# Altium schematic sheet Peripherals.SchDoc
size A4; SheetNumber: 3; SheetTotal: 6
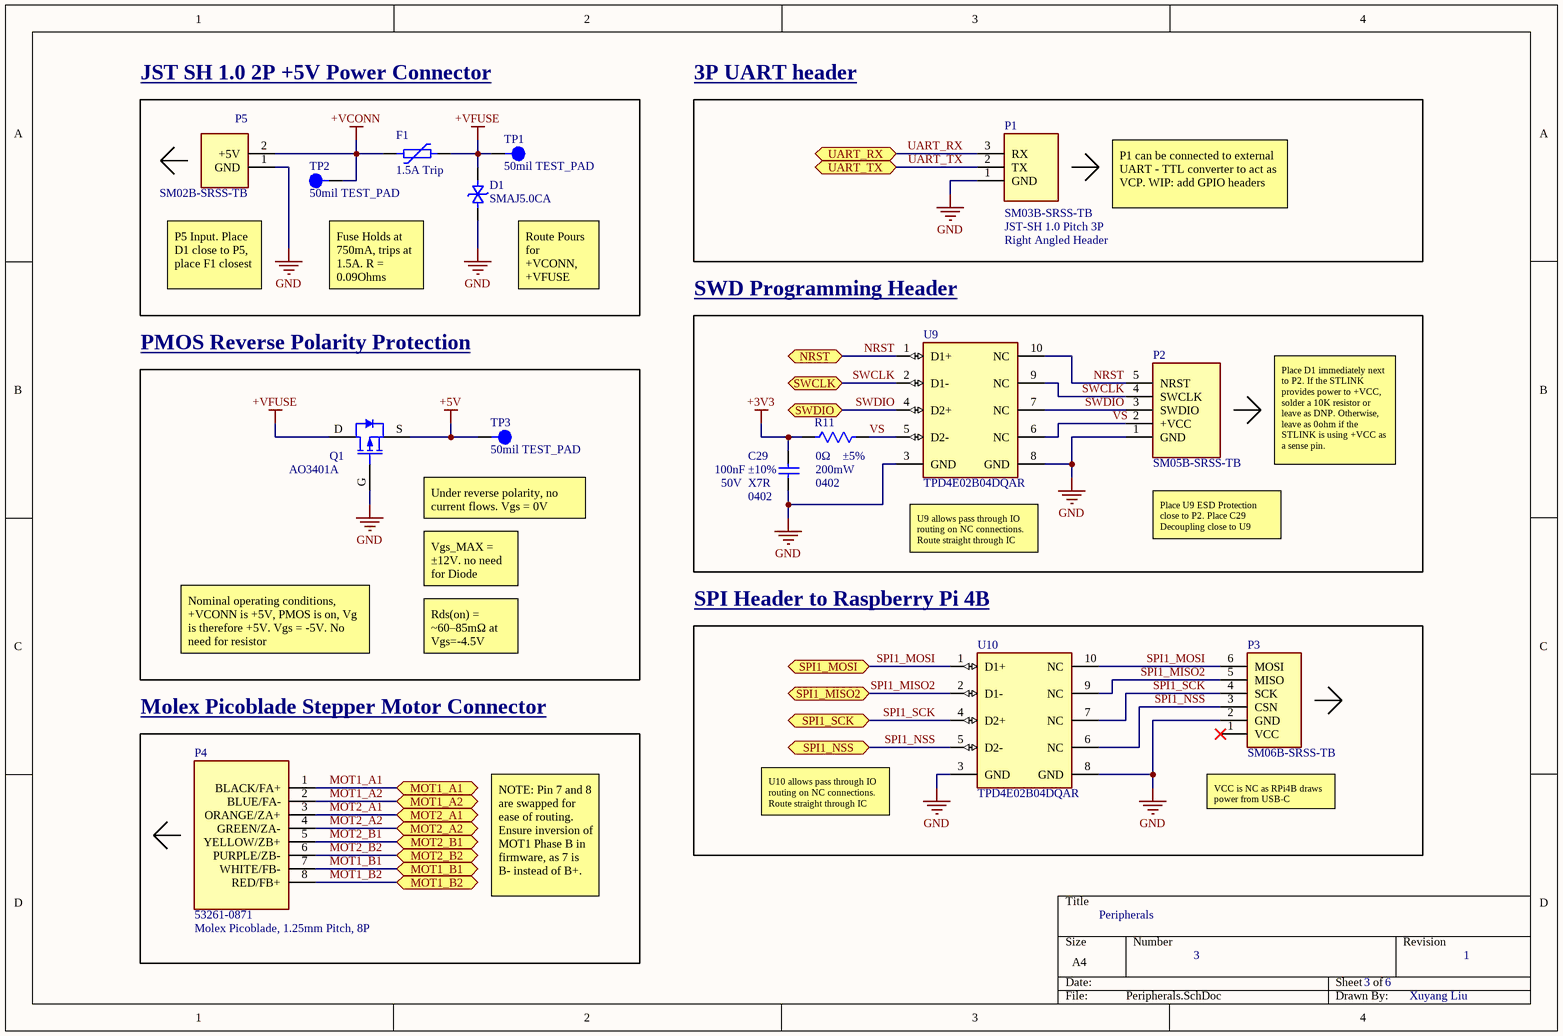
[diagram p0: Peripherals.SchDoc]

## Parts
C29  Case/Package: 0402  Voltage Rating: 50V  Dielectric: X7R  Tolerance: ±10%  [0402_Cap]  (hidden comment: 100nF)
D1  SMAJ5.0CA  [DIOM5026X229N]
F1  1.5A Trip  [1206_PTC]
P1  SM03B-SRSS-TB  [SM03B-SRSS-TB]
P2  SM05B-SRSS-TB  [SM05B-SRSS-TB]
P3  SM06B-SRSS-TB  [SM06B-SRSS-TB]
P4  53261-0871  [FP-532610871-MFG]
P5  SM02B-SRSS-TB  [SM02B-SRSS-TB]
Q1  AO3401A  [AO-SOT-23-3L_V]
R11  Tolerance: ±5%  Power Rating: 200mW  Case/Package: 0402  Resistance: 0Ω  [0402_RES]  (hidden comment: 0R)
TP1  50mil TEST_PAD  [15mil_TEST_PAD]
TP2  50mil TEST_PAD  [15mil_TEST_PAD]
TP3  50mil TEST_PAD  [15mil_TEST_PAD]
U9  TPD4E02B04DQAR  [FP-DQA0010A-MFG]
U10  TPD4E02B04DQAR  [FP-DQA0010A-MFG]

## Blocks framed on the sheet
JST SH 1.0 2P +5V Power Connector: D1 F1 P5 TP1 TP2
3P UART header: P1
SWD Programming Header: C29 P2 R11 U9
PMOS Reverse Polarity Protection: Q1 TP3
SPI Header to Raspberry Pi 4B: P3 U10
Molex Picoblade Stepper Motor Connector: P4

## Ports
MOT1_A1 (bidir), MOT1_A2 (bidir), MOT1_B1 (bidir), MOT1_B2 (bidir), MOT2_A1 (bidir), MOT2_A2 (bidir), MOT2_B1 (bidir), MOT2_B2 (bidir), NRST (bidir), SPI1_MISO2 (bidir), SPI1_MOSI (bidir), SPI1_NSS (bidir), SPI1_SCK (bidir), SWCLK (bidir), SWDIO (bidir), UART_RX (bidir), UART_TX (bidir)

## Nets
+3V3: C29.2 R11.1
+5V: Q1.S(SOURCE) TP3.1
+VCONN: F1.1 P5.2(+5V) TP2.1
+VFUSE: D1.2 F1.2 Q1.D(DRAIN) TP1.1
GND: C29.1 D1.1 P1.1(GND) P2.1(GND) P3.2(GND) P5.1(GND) Q1.G(GATE) U9.3(GND) U9.8(GND) U10.3(GND) U10.8(GND)
MOT1_A1: P4.1(BLACK/FA+) ; port MOT1_A1
MOT1_A2: P4.2(BLUE/FA-) ; port MOT1_A2
MOT1_B1: P4.7(WHITE/FB-) ; port MOT1_B1
MOT1_B2: P4.8(RED/FB+) ; port MOT1_B2
MOT2_A1: P4.3(ORANGE/ZA+) ; port MOT2_A1
MOT2_A2: P4.4(GREEN/ZA-) ; port MOT2_A2
MOT2_B1: P4.5(YELLOW/ZB+) ; port MOT2_B1
MOT2_B2: P4.6(PURPLE/ZB-) ; port MOT2_B2
NRST: P2.5(NRST) U9.1(D1+) U9.10(NC) ; port NRST
SPI1_MISO2: P3.5(MISO) U10.2(D1-) U10.9(NC) ; port SPI1_MISO2
SPI1_MOSI: P3.6(MOSI) U10.1(D1+) U10.10(NC) ; port SPI1_MOSI
SPI1_NSS: P3.3(CSN) U10.5(D2-) U10.6(NC) ; port SPI1_NSS
SPI1_SCK: P3.4(SCK) U10.4(D2+) U10.7(NC) ; port SPI1_SCK
SWCLK: P2.4(SWCLK) U9.2(D1-) U9.9(NC) ; port SWCLK
SWDIO: P2.3(SWDIO) U9.4(D2+) U9.7(NC) ; port SWDIO
UART_RX: P1.3(RX) ; port UART_RX
UART_TX: P1.2(TX) ; port UART_TX
VS: P2.2(+VCC) R11.2 U9.5(D2-) U9.6(NC)

Not connected (* = marked no-connect by the designer): P3 1(VCC)*

## Notes on the sheet
- (near P1) JST-SH 1.0 Pitch 3P
- Right Angled Header
- P1 can be connected to external UART - TTL converter to act as VCP. WIP: add GPIO headers
- P5 Input. Place D1 close to P5, place F1 closest
- Fuse Holds at 750mA, trips at 1.5A. R = 0.09Ohms
- (near D1) Route Pours for +VCONN, +VFUSE
- Under reverse polarity, no current flows. Vgs = 0V
- Place D1 immediately next to P2. If the STLINK provides power to +VCC, solder a 10K resistor or leave as DNP. Otherwise, leave as 0ohm if the STLINK is using +VCC as a sense pin.
- Vgs_MAX = ±12V. no need for Diode
- (near U9) U9 allows pass through IO routing on NC connections. Route straight through IC
- Place U9 ESD Protection close to P2. Place C29 Decoupling close to U9
- Nominal operating conditions, +VCONN is +5V, PMOS is on, Vg is therefore +5V. Vgs = -5V. No need for resistor
- Rds(on) = ~60–85mΩ at Vgs=-4.5V
- U10 allows pass through IO routing on NC connections. Route straight through IC
- (near P3) VCC is NC as RPi4B draws power from USB-C
- NOTE: Pin 7 and 8 are swapped for ease of routing. Ensure inversion of MOT1 Phase B in firmware, as 7 is B- instead of B+.
- Peripherals
- (near P4) Molex Picoblade, 1.25mm Pitch, 8P
- 3
- 3     6
- 1
- Xuyang Liu

## Library data of the parts
C29 = GCM155R71H104KE02J: 50V 100nF X7R ±10% 0402 Multilayer Ceramic Capacitors MLCC - SMD/SMT ROHS; Manufacturer: Murata; Manufacturer Lifecycle Status: IN PRODUCTION; Supplier 1: DigiKey; Manufacturer Part Number: GCM155R71H104KE02J; RoHS: Compliant; Category: Ceramic Capacitors; Stock 1: 13930662; Pricing 1: 1=0.1, 10=0.034, 50=0.0226, 100=0.0193, 500=0.01374, 1000=0.01205, 2500=0.01027, 5000=0.0092 (USD); Case Code (Imperial): 0402; Case Code (Metric): 1005; Country of Origin: Philippines; Dielectric Material: Ceramic; Export Control Classification Number (ECCN) Code: EAR99; Height: 500µm; Harmonized Tariff Schedule (HTS) Code: 8532.24.00.20; Introduction Date: 2013-11-20; Length: 1mm; Lifecycle Status: Production; Material: Ceramic; Max Operating Temperature: 125°C; Min Operating Temperature: -55°C; Mount: Surface Mount; Number of Terminals: 2; Packaging: Tape & Reel (TR); Ratings: AEC-Q200; REACH SVHC: Yes; Schedule B: 8532240020, 8532240020|8532240020, 8532240020|8532240020|8532240020, 8532240020|8532240020|8532240020|8532240020; Termination: SMD/SMT; Voltage Rating (DC): 50V; Weight: 6.010099mg; Width: 500µm; ComponentLink1URL: https://datasheet.octopart.com:443/GCM155R71H104KE02J-Murata-datasheet-155345015.pdf?src-supplier=Newark; ComponentLink1Description: https://datasheet.octopart.com:443/GCM155R71H104KE02J-Murata-datasheet-155345015.pdf?src-supplier=Newark; ComponentLink2URL: https://datasheet.octopart.com:443/GCM155R71H104KE02J-Murata-datasheet-178519985.pdf?src-supplier=Arrow.cn; ComponentLink2Description: https://datasheet.octopart.com:443/GCM155R71H104KE02J-Murata-datasheet-178519985.pdf?src-supplier=Arrow.cn; ComponentLink3URL: https://datasheet.octopart.com:443/GCM155R71H104KE02J-Murata-datasheet-141266224.pdf?src-supplier=Ciiva; ComponentLink3Description: https://datasheet.octopart.com:443/GCM155R71H104KE02J-Murata-datasheet-141266224.pdf?src-supplier=Ciiva; ComponentLink4URL: https://datasheet.octopart.com:443/GCM155R71H104KE02J-Murata-datasheet-140656751.pdf?src-supplier=Ciiva; ComponentLink4Description: https://datasheet.octopart.com:443/GCM155R71H104KE02J-Murata-datasheet-140656751.pdf?src-supplier=Ciiva; ComponentLink5URL: https://datasheet.octopart.com:443/GCM155R71H104KE02J-Murata-datasheet-138716456.pdf?src-supplier=Ciiva; ComponentLink5Description: https://datasheet.octopart.com:443/GCM155R71H104KE02J-Murata-datasheet-138716456.pdf?src-supplier=Ciiva; ComponentLink6URL: https://datasheet.octopart.com:443/GCM155R71H104KE02J-Murata-datasheet-77992203.pdf?src-supplier=Future+Electronics; ComponentLink6Description: https://datasheet.octopart.com:443/GCM155R71H104KE02J-Murata-datasheet-77992203.pdf?src-supplier=Future+Electronics; ComponentLink7URL: https://datasheet.octopart.com:443/GCM155R71H104KE02J-Murata-datasheet-12511495.pdf?src-supplier=TME; ComponentLink7Description: https://datasheet.octopart.com:443/GCM155R71H104KE02J-Murata-datasheet-12511495.pdf?src-supplier=TME; ComponentLink8URL: http://sigma.octopart.com:80/reach_statement/Murata-company-16.pdf?src-supplier=Compliance+Statements; ComponentLink8Description: http://sigma.octopart.com:80/reach_statement/Murata-company-16.pdf?src-supplier=Compliance+Statements; Supplier Part Number 1: 490-14514-6-ND; Capacitance: 100nF
D1 = SMAJ5.0CA: DO-214AC SMA SMAJ 1 Surface Mount Zener Tvs Diode 6.4V 43.5A 400W 1.05nF; Manufacturer: Littelfuse; Breakdown Voltage: 6.7V; Clamping Voltage: 9.2V; Direction: Bidirectional; Element Configuration: Single; Forward Voltage: 3.5V; Leakage Current: 1.6mA; Max Breakdown Voltage: 7V; Max Junction Temperature (Tj): 150°C; Max Power Dissipation: 3.3W; Max Reverse Leakage Current: 800µA; Number of Bidirectional Channels: 1; Operating Supply Voltage: 5V; Power Line Protection: No; Test Current: 10mA; Supplier 1: DigiKey; Manufacturer Part Number: SMAJ5.0CA; RoHS: Compliant; Category: TVS Diodes; Stock 1: 14649; Pricing 1: 1=0.48, 10=0.295, 100=0.1863, 500=0.13922, 1000=0.124, 2000=0.11117 (USD); Capacitance: 1.05nF; China RoHS: Non-Compliant; Composition: Zener; Height: 2.29mm; Lead Free: Lead Free; Length: 4.5mm; Lifecycle Status: Production; Max Operating Temperature: 150°C; Max Output Current: 43.5A; Max Surge Current: 43.5A; Min Breakdown Voltage: 6.4V; Min Operating Temperature: -65°C; Mount: Surface Mount; Number of Channels: 1; Number of Elements: 1; Number of Pins: 2; Number of Terminals: 2; Packaging: Tape & Reel; Peak Pulse Current: 43.5A; Peak Pulse Power: 400W; Peak Reverse Current: 800µA; Polarity: Bidirectional; Power Dissipation: 400W; Power Rating: 400W; Radiation Hardening: No; REACH SVHC: No; Reverse Breakdown Voltage: 6.4V; Reverse Standoff Voltage: 5V; Reverse Voltage: 5V; Schedule B: 8541100080, 8541100080|8541100080|8541100080|8541100080|8541100080; Termination: SMD/SMT; Voltage Rating (DC): 5V; Width: 2.79mm; ComponentLink1URL: https://datasheet.octopart.com:443/SMAJ5.0CA-Littelfuse-datasheet-150463581.pdf?src-supplier=IHS; ComponentLink1Description: https://datasheet.octopart.com:443/SMAJ5.0CA-Littelfuse-datasheet-150463581.pdf?src-supplier=IHS; ComponentLink2URL: https://datasheet.octopart.com:443/SMAJ5.0CA-Littelfuse-datasheet-11547152.pdf?src-supplier=element14+APAC; ComponentLink2Description: https://datasheet.octopart.com:443/SMAJ5.0CA-Littelfuse-datasheet-11547152.pdf?src-supplier=element14+APAC; ComponentLink3URL: https://datasheet.octopart.com:443/SMAJ5.0CA-Littelfuse-datasheet-5393952.pdf?src-supplier=element14+APAC; ComponentLink3Description: https://datasheet.octopart.com:443/SMAJ5.0CA-Littelfuse-datasheet-5393952.pdf?src-supplier=element14+APAC; ComponentLink4URL: https://datasheet.octopart.com:443/SMAJ5.0CA-Littelfuse-datasheet-511791.pdf?src-supplier=element14+APAC; ComponentLink4Description: https://datasheet.octopart.com:443/SMAJ5.0CA-Littelfuse-datasheet-511791.pdf?src-supplier=element14+APAC; ComponentLink5URL: https://datasheet.octopart.com:443/SMAJ5.0CA-Littelfuse-datasheet-63710798.pdf?src-supplier=Farnell; ComponentLink5Description: https://datasheet.octopart.com:443/SMAJ5.0CA-Littelfuse-datasheet-63710798.pdf?src-supplier=Farnell; ComponentLink6URL: https://datasheet.octopart.com:443/SMAJ5.0CA-Littelfuse-datasheet-165289143.pdf?src-supplier=Electro+Sonic; ComponentLink6Description: https://datasheet.octopart.com:443/SMAJ5.0CA-Littelfuse-datasheet-165289143.pdf?src-supplier=Electro+Sonic; ComponentLink7URL: https://datasheet.octopart.com:443/SMAJ5.0CA-Littelfuse-datasheet-1053.pdf?src-supplier=DigiKey; ComponentLink7Description: https://datasheet.octopart.com:443/SMAJ5.0CA-Littelfuse-datasheet-1053.pdf?src-supplier=DigiKey; ComponentLink8URL: https://datasheet.octopart.com:443/SMAJ5.0CA-Littelfuse-datasheet-164649624.pdf?src-supplier=JRH+Electronics; ComponentLink8Description: https://datasheet.octopart.com:443/SMAJ5.0CA-Littelfuse-datasheet-164649624.pdf?src-supplier=JRH+Electronics; ComponentLink9URL: https://datasheet.octopart.com:443/SMAJ5.0CA-Littelfuse-datasheet-17901671.pdf?src-supplier=Future+Electronics; ComponentLink9Description: https://datasheet.octopart.com:443/SMAJ5.0CA-Littelfuse-datasheet-17901671.pdf?src-supplier=Future+Electronics; Supplier Part Number 1: SMAJ5.0CALFCT-ND
F1 = 1206L075THYR: PTC Resettable Fuse 0.75A(hold) 1.5A(trip) 8VDC 100A 0.6W 0.2s 0.09Ohm SMD Solder Pad 1206 T/R; Manufacturer: Littelfuse; Approvals: TUV, cULus; Hold Current: 750mA; Maximum Resistance 1 Hour (R1max): 290mΩ; Max Supply Voltage (DC): 8V; Minimum Resistance Initial (Rmin): 90mΩ; Power Dissipation: 600mW; Ratings: TUV; Time to Trip: 200ms; Supplier 1: DigiKey; Manufacturer Part Number: 1206L075THYR; RoHS: Compliant; Category: PTC Resettable Fuses; Stock 1: 23337; Pricing 1: 1=0.64, 5=0.528, 10=0.488, 50=0.4048, 100=0.3734, 250=0.33572, 500=0.30966, 1000=0.28553 (USD); Case/Package: 1206; Case Code (Imperial): 1206; Case Code (Metric): 3216; China RoHS: Compliant; Current Rating: 100A; Export Control Classification Number (ECCN) Code: EAR99; Height: 750µm; Harmonized Tariff Schedule (HTS) Code: 8533.40.80.70; Introduction Date: 2009-08-04; Lead Free: Lead Free; Length: 3.4mm; Lifecycle Status: Production; Max Current Rating: 100A; Max Operating Temperature: 85°C; Max Voltage Rating (DC): 8V; Min Operating Temperature: -40°C; Mount: Surface Mount; Number of Terminals: 2; Operating Supply Voltage: 8V; Packaging: Cut Tape; REACH SVHC: Yes; Resistance: 90mΩ; Termination: SMD/SMT; Trip Current: 1.5A; Voltage Rating (DC): 8V; Width: 1.8mm; Working Voltage: 8V; ComponentLink1URL: https://datasheet.octopart.com:443/1206L075THYR-Littelfuse-datasheet-181956355.pdf?src-supplier=Farnell; ComponentLink1Description: https://datasheet.octopart.com:443/1206L075THYR-Littelfuse-datasheet-181956355.pdf?src-supplier=Farnell; ComponentLink2URL: https://datasheet.octopart.com:443/1206L075THYR-Littelfuse-datasheet-8722135.pdf?src-supplier=Farnell; ComponentLink2Description: https://datasheet.octopart.com:443/1206L075THYR-Littelfuse-datasheet-8722135.pdf?src-supplier=Farnell; ComponentLink3URL: https://datasheet.octopart.com:443/1206L075THYR-Littelfuse-datasheet-12510028.pdf?src-supplier=Farnell; ComponentLink3Description: https://datasheet.octopart.com:443/1206L075THYR-Littelfuse-datasheet-12510028.pdf?src-supplier=Farnell; ComponentLink4URL: https://datasheet.octopart.com:443/1206L075THYR-Littelfuse-datasheet-10365336.pdf?src-supplier=Farnell; ComponentLink4Description: https://datasheet.octopart.com:443/1206L075THYR-Littelfuse-datasheet-10365336.pdf?src-supplier=Farnell; ComponentLink5URL: https://datasheet.octopart.com:443/1206L075THYR-Littelfuse-datasheet-8701791.pdf?src-supplier=Farnell; ComponentLink5Description: https://datasheet.octopart.com:443/1206L075THYR-Littelfuse-datasheet-8701791.pdf?src-supplier=Farnell; ComponentLink6URL: https://datasheet.octopart.com:443/1206L075THYR-Littelfuse-datasheet-8325659.pdf?src-supplier=Farnell; ComponentLink6Description: https://datasheet.octopart.com:443/1206L075THYR-Littelfuse-datasheet-8325659.pdf?src-supplier=Farnell; ComponentLink7URL: https://datasheet.octopart.com:443/1206L075THYR-Littelfuse-datasheet-8821216.pdf?src-supplier=element14+APAC; ComponentLink7Description: https://datasheet.octopart.com:443/1206L075THYR-Littelfuse-datasheet-8821216.pdf?src-supplier=element14+APAC; ComponentLink8URL: https://datasheet.octopart.com:443/1206L075THYR-Littelfuse-datasheet-165518606.pdf?src-supplier=Newark; ComponentLink8Description: https://datasheet.octopart.com:443/1206L075THYR-Littelfuse-datasheet-165518606.pdf?src-supplier=Newark; ComponentLink9URL: https://datasheet.octopart.com:443/1206L075THYR-Littelfuse-datasheet-8814422.pdf?src-supplier=Newark; ComponentLink9Description: https://datasheet.octopart.com:443/1206L075THYR-Littelfuse-datasheet-8814422.pdf?src-supplier=Newark; ComponentLink10URL: https://datasheet.octopart.com:443/1206L075THYR-Littelfuse-datasheet-130008768.pdf?src-supplier=ODG+(Origin+Data+Global); ComponentLink10Description: https://datasheet.octopart.com:443/1206L075THYR-Littelfuse-datasheet-130008768.pdf?src-supplier=ODG+(Origin+Data+Global); ComponentLink11URL: https://datasheet.octopart.com:443/1206L075THYR-Littelfuse-datasheet-26530142.pdf?src-supplier=Fuses+Unlimited; ComponentLink11Description: https://datasheet.octopart.com:443/1206L075THYR-Littelfuse-datasheet-26530142.pdf?src-supplier=Fuses+Unlimited; ComponentLink12URL: https://datasheet.octopart.com:443/1206L075THYR-Littelfuse-datasheet-183575726.pdf?src-supplier=Sager+Electronics; ComponentLink12Description: https://datasheet.octopart.com:443/1206L075THYR-Littelfuse-datasheet-183575726.pdf?src-supplier=Sager+Electronics; ComponentLink13URL: https://datasheet.octopart.com:443/1206L075THYR-Littelfuse-datasheet-176144932.pdf?src-supplier=Sager+Electronics; ComponentLink13Description: https://datasheet.octopart.com:443/1206L075THYR-Littelfuse-datasheet-176144932.pdf?src-supplier=Sager+Electronics; ComponentLink14URL: https://datasheet.octopart.com:443/1206L075THYR-Littelfuse-datasheet-170674161.pdf?src-supplier=Future+Electronics; ComponentLink14Description: https://datasheet.octopart.com:443/1206L075THYR-Littelfuse-datasheet-170674161.pdf?src-supplier=Future+Electronics; ComponentLink15URL: https://datasheet.octopart.com:443/1206L075THYR-Littelfuse-datasheet-20852186.pdf?src-supplier=Future+Electronics; ComponentLink15Description: https://datasheet.octopart.com:443/1206L075THYR-Littelfuse-datasheet-20852186.pdf?src-supplier=Future+Electronics; ComponentLink16URL: https://datasheet.octopart.com:443/1206L075THYR-Littelfuse-datasheet-177174148.pdf?src-supplier=Burklin+Elektronik; ComponentLink16Description: https://datasheet.octopart.com:443/1206L075THYR-Littelfuse-datasheet-177174148.pdf?src-supplier=Burklin+Elektronik; Supplier Part Number 1: F3370CT-ND
P1 = SM03B-SRSS-TB_UART: Board Connector, 3 Contact(s), 1 Row(s), Male, Right Angle, Surface Mount Terminal; Manufacturer: JST; Connector Type: Male Pin; Number of Contacts: 3; Pitch: 990.6µm; Supplier 1: DigiKey; Manufacturer Part Number: SM03B-SRSS-TB; RoHS: Compliant; Category: Card Edge Connectors; Stock 1: 14167; Pricing 1: 1=0.44, 10=0.373, 100=0.317, 500=0.2829, 1000=0.26938 (USD); Color: Natural; Contact Gender: Male; Contact Plating: Tin; Housing Color: Natural; Housing Material: Nylon; Lead Free: Contains Lead; Lifecycle Status: Obsolete; Max Operating Temperature: 85°C; Min Operating Temperature: -25°C; Mount: Surface Mount; Number of Pins: 3; Number of Positions: 3; Number of Rows: 1; Orientation: Horizontal; Terminal Pitch: 1mm; Termination: Solder; ComponentLink1URL: https://datasheet.octopart.com:443/SM03B-SRSS-TB-JST-datasheet-180492086.pdf?src-supplier=IHS; ComponentLink1Description: https://datasheet.octopart.com:443/SM03B-SRSS-TB-JST-datasheet-180492086.pdf?src-supplier=IHS; ComponentLink2URL: https://datasheet.octopart.com:443/SM03B-SRSS-TB-JST-datasheet-44103209.pdf?src-supplier=TME; ComponentLink2Description: https://datasheet.octopart.com:443/SM03B-SRSS-TB-JST-datasheet-44103209.pdf?src-supplier=TME; ComponentLink3URL: https://datasheet.octopart.com:443/SM03B-SRSS-TB-JST-datasheet-118603.pdf?src-supplier=DigiKey; ComponentLink3Description: https://datasheet.octopart.com:443/SM03B-SRSS-TB-JST-datasheet-118603.pdf?src-supplier=DigiKey; ComponentLink4URL: https://datasheet.octopart.com:443/SM03B-SRSS-TB-JST-datasheet-152738602.pdf?src-supplier=Amar+Radio+Corporation; ComponentLink4Description: https://datasheet.octopart.com:443/SM03B-SRSS-TB-JST-datasheet-152738602.pdf?src-supplier=Amar+Radio+Corporation
P2 = SM05B-SRSS-TB-SWD: Board Connector, 5 Contact(s), 1 Row(s), Male, Right Angle, Surface Mount Terminal; Manufacturer: JST; Connector Type: Male Pin; Number of Contacts: 5; Pitch: 990.6µm; Supplier 1: DigiKey; Manufacturer Part Number: SM05B-SRSS-TB; RoHS: Compliant; Category: Card Edge Connectors; Stock 1: 42194; Pricing 1: 1=0.62, 10=0.527, 100=0.4477, 500=0.3996, 1000=0.38051 (USD); Color: Natural; Contact Plating: Tin; Export Control Classification Number (ECCN) Code: EAR99; Gender: Male; Housing Color: Natural; Housing Material: Nylon; Harmonized Tariff Schedule (HTS) Code: 8536.69.40.40; Introduction Date: 1996-04-01; Lead Free: Contains Lead; Lifecycle Status: Obsolete; Mount: Surface Mount; Number of Positions: 5; Number of Rows: 1; Orientation: Right Angle; Terminal Pitch: 1mm; Termination: Solder; ComponentLink1URL: https://datasheet.octopart.com:443/SM05B-SRSS-TB-JST-datasheet-180492086.pdf?src-supplier=IHS; ComponentLink1Description: https://datasheet.octopart.com:443/SM05B-SRSS-TB-JST-datasheet-180492086.pdf?src-supplier=IHS; ComponentLink2URL: https://datasheet.octopart.com:443/SM05B-SRSS-TB-JST-datasheet-118603.pdf?src-supplier=DigiKey; ComponentLink2Description: https://datasheet.octopart.com:443/SM05B-SRSS-TB-JST-datasheet-118603.pdf?src-supplier=DigiKey; ComponentLink3URL: https://datasheet.octopart.com:443/SM05B-SRSS-TB-JST-datasheet-152738602.pdf?src-supplier=Amar+Radio+Corporation; ComponentLink3Description: https://datasheet.octopart.com:443/SM05B-SRSS-TB-JST-datasheet-152738602.pdf?src-supplier=Amar+Radio+Corporation
P3 = SM06B-SRSS-TB_SPI: Board Connector, 6 Contact(s), 1 Row(s), Male, Right Angle, 0.039 inch Pitch, Surface Mount Terminal; Manufacturer: JST; Connector Type: Male Pin; Dielectric Material: Polyamide; Number of Contacts: 6; Pitch: 990.6µm; Supplier 1: DigiKey; Manufacturer Part Number: SM06B-SRSS-TB; RoHS: Compliant; Category: Card Edge Connectors; Stock 1: 26532; Pricing 1: 1=0.67, 10=0.567, 100=0.4821, 500=0.43024, 1000=0.40969 (USD); Color: Natural; Contact Gender: Male; Contact Plating: Tin; Housing Color: Natural; Housing Material: Nylon; Lead Free: Contains Lead; Lifecycle Status: Obsolete; Max Operating Temperature: 85°C; Manufacturer Package Identifier: SM06B-SRSS-TB; Min Operating Temperature: -25°C; Mount: Surface Mount; Number of Pins: 6; Number of Positions: 6; Number of Rows: 1; Orientation: Horizontal; Terminal Pitch: 1mm; Termination: Solder; ComponentLink1URL: https://datasheet.octopart.com:443/SM06B-SRSS-TB-JST-datasheet-118603.pdf?src-supplier=Upverter; ComponentLink1Description: https://datasheet.octopart.com:443/SM06B-SRSS-TB-JST-datasheet-118603.pdf?src-supplier=Upverter; ComponentLink2URL: https://datasheet.octopart.com:443/SM06B-SRSS-TB-JST-datasheet-180492086.pdf?src-supplier=IHS; ComponentLink2Description: https://datasheet.octopart.com:443/SM06B-SRSS-TB-JST-datasheet-180492086.pdf?src-supplier=IHS; ComponentLink3URL: https://datasheet.octopart.com:443/SM06B-SRSS-TB-JST-datasheet-44103209.pdf?src-supplier=TME; ComponentLink3Description: https://datasheet.octopart.com:443/SM06B-SRSS-TB-JST-datasheet-44103209.pdf?src-supplier=TME; ComponentLink4URL: https://datasheet.octopart.com:443/SM06B-SRSS-TB-JST-datasheet-152738602.pdf?src-supplier=Amar+Radio+Corporation; ComponentLink4Description: https://datasheet.octopart.com:443/SM06B-SRSS-TB-JST-datasheet-152738602.pdf?src-supplier=Amar+Radio+Corporation
P4 = 53261-0871: 1.25mm (.049") Pitch PicoBlade Header, Surface Mount, Right Angle, Lead-free, 8 Circuits; Manufacturer: Molex; Manufacturer Lifecycle Status: ACTIVE; Contact Resistance: 20mΩ; Current Rating: 1A; Gender: Male; Glow Wire Compliant: Non-compliant; Insulation Resistance: 100MΩ; Number of Circuits: 7; Number of Contacts: 8; Pitch: 1.2446mm; Plating: Tin; Plating Thickness: 990.6nm; Ratings: CSA; Voltage Rating: 125V; Supplier 1: DigiKey; Manufacturer Part Number: 53261-0871; RoHS: Compliant; Category: Headers and Wire Housings; Stock 1: 32917; Pricing 1: 1=0.91, 10=0.772, 100=0.6556, 500=0.58518 (USD); Ambient Temperature Range High: 105°C; China RoHS: Compliant; Color: Beige; Contact Material: Nickel, Tin; Contact Plating: Tin; Country of Origin: SG; Flammability Rating: UL94 V-0; Height: 3.6mm; Lead Free: Lead Free; Lead Pitch: 1.25mm; Lifecycle Status: Production; Max Operating Temperature: 105°C; Min Operating Temperature: -40°C; Mount: Surface Mount; Number of Pins: 8; Number of Positions: 8; Number of Rows: 1; Orientation: Right Angle; Packaging: Cut Tape; Radiation Hardening: No; REACH SVHC: Yes; Schedule B: 8536694040, 8536694040|8536694040|8536694040|8536694040|8536694040|8536694040|8536694040|8536694040|8536694040|8536694040|8536694040|8536694040|8536694040|8536694040|8536694040|8536694040|8536694040|8536694040|8536694040|8536694040|8536694040|8536694040|8536694040|85; Terminal Pitch: 1.25mm; Termination: Solder; Voltage Rating (AC): 125V; Voltage Rating (DC): 125V; Working Voltage: 125V; ComponentLink1URL: https://datasheet.octopart.com:443/53261-0871-Molex-datasheet-177725531.pdf?src-supplier=Farnell; ComponentLink1Description: https://datasheet.octopart.com:443/53261-0871-Molex-datasheet-177725531.pdf?src-supplier=Farnell; ComponentLink2URL: https://datasheet.octopart.com:443/53261-0871-Molex-datasheet-11023919.pdf?src-supplier=Farnell; ComponentLink2Description: https://datasheet.octopart.com:443/53261-0871-Molex-datasheet-11023919.pdf?src-supplier=Farnell; ComponentLink3URL: https://datasheet.octopart.com:443/53261-0871-Molex-datasheet-101583405.pdf?src-supplier=Farnell; ComponentLink3Description: https://datasheet.octopart.com:443/53261-0871-Molex-datasheet-101583405.pdf?src-supplier=Farnell; ComponentLink4URL: https://datasheet.octopart.com:443/532610871-Molex-datasheet-520094.pdf?src-supplier=Farnell; ComponentLink4Description: https://datasheet.octopart.com:443/532610871-Molex-datasheet-520094.pdf?src-supplier=Farnell; ComponentLink5URL: https://sigma.octopart.com:443/140425834/technical_drawing/Molex-53261-0871.pdf?src-supplier=Upverter; ComponentLink5Description: https://sigma.octopart.com:443/140425834/technical_drawing/Molex-53261-0871.pdf?src-supplier=Upverter; ComponentLink6URL: https://datasheet.octopart.com:443/53261-0871-Molex-datasheet-140462602.pdf?src-supplier=Upverter; ComponentLink6Description: https://datasheet.octopart.com:443/53261-0871-Molex-datasheet-140462602.pdf?src-supplier=Upverter; ComponentLink7URL: https://datasheet.octopart.com:443/53261-0871-Molex-datasheet-12537161.pdf?src-supplier=_legacy+Avnet; ComponentLink7Description: https://datasheet.octopart.com:443/53261-0871-Molex-datasheet-12537161.pdf?src-supplier=_legacy+Avnet; ComponentLink8URL: https://datasheet.octopart.com:443/532610871-Molex-datasheet-8343080.pdf?src-supplier=TME; ComponentLink8Description: https://datasheet.octopart.com:443/532610871-Molex-datasheet-8343080.pdf?src-supplier=TME; ComponentLink9URL: https://datasheet.octopart.com:443/53261-0871-Molex-datasheet-10404416.pdf?src-supplier=Molex; ComponentLink9Description: https://datasheet.octopart.com:443/53261-0871-Molex-datasheet-10404416.pdf?src-supplier=Molex; ComponentLink10URL: https://sigma.octopart.com:443/16413766/technical_drawing/Molex-53261-0871.pdf?src-supplier=Molex; ComponentLink10Description: https://sigma.octopart.com:443/16413766/technical_drawing/Molex-53261-0871.pdf?src-supplier=Molex; ComponentLink11URL: https://datasheet.octopart.com:443/53261-0871-Molex-datasheet-154756037.pdf?src-supplier=Master+Electronics; ComponentLink11Description: https://datasheet.octopart.com:443/53261-0871-Molex-datasheet-154756037.pdf?src-supplier=Master+Electronics; ComponentLink12URL: https://datasheet.octopart.com:443/53261-0871-Molex-datasheet-21208676.pdf?src-supplier=Electro+Sonic; ComponentLink12Description: https://datasheet.octopart.com:443/53261-0871-Molex-datasheet-21208676.pdf?src-supplier=Electro+Sonic; ComponentLink13URL: https://datasheet.octopart.com:443/53261-0871-Molex-datasheet-62105452.pdf?src-supplier=Electro+Sonic; ComponentLink13Description: https://datasheet.octopart.com:443/53261-0871-Molex-datasheet-62105452.pdf?src-supplier=Electro+Sonic; ComponentLink14URL: https://datasheet.octopart.com:443/53261-0871-Molex-datasheet-8522546.pdf?src-supplier=element14; ComponentLink14Description: https://datasheet.octopart.com:443/53261-0871-Molex-datasheet-8522546.pdf?src-supplier=element14; ComponentLink15URL: https://datasheet.octopart.com:443/53261-0871-Molex-datasheet-100429.pdf?src-supplier=element14; ComponentLink15Description: https://datasheet.octopart.com:443/53261-0871-Molex-datasheet-100429.pdf?src-supplier=element14; ComponentLink16URL: https://datasheet.octopart.com:443/0532610871-Molex-datasheet-157440116.pdf?src-supplier=Sager+Electronics; ComponentLink16Description: https://datasheet.octopart.com:443/0532610871-Molex-datasheet-157440116.pdf?src-supplier=Sager+Electronics; ComponentLink17URL: https://datasheet.octopart.com:443/53261-0871-Molex-datasheet-140186590.pdf?src-supplier=RS+(Formerly+Allied+Electronics); ComponentLink17Description: https://datasheet.octopart.com:443/53261-0871-Molex-datasheet-140186590.pdf?src-supplier=RS+(Formerly+Allied+Electronics); ComponentLink18URL: https://datasheet.octopart.com:443/53261-0871-Molex-datasheet-120153903.pdf?src-supplier=RS+(Formerly+Allied+Electronics); ComponentLink18Description: https://datasheet.octopart.com:443/53261-0871-Molex-datasheet-120153903.pdf?src-supplier=RS+(Formerly+Allied+Electronics); ComponentLink19URL: https://datasheet.octopart.com:443/53261-0871-Molex-datasheet-34442330.pdf?src-supplier=RS+(Formerly+Allied+Electronics); ComponentLink19Description: https://datasheet.octopart.com:443/53261-0871-Molex-datasheet-34442330.pdf?src-supplier=RS+(Formerly+Allied+Electronics); ComponentLink20URL: https://datasheet.octopart.com:443/532610871-Molex-datasheet-137316104.pdf?src-supplier=Future+Electronics; ComponentLink20Description: https://datasheet.octopart.com:443/532610871-Molex-datasheet-137316104.pdf?src-supplier=Future+Electronics; ComponentLink21URL: https://datasheet.octopart.com:443/53261-0871-Molex-datasheet-33003884.pdf?src-supplier=Newark; ComponentLink21Description: https://datasheet.octopart.com:443/53261-0871-Molex-datasheet-33003884.pdf?src-supplier=Newark; ComponentLink22URL: https://datasheet.octopart.com:443/53261-0871-Molex-datasheet-33003883.pdf?src-supplier=Newark; ComponentLink22Description: https://datasheet.octopart.com:443/53261-0871-Molex-datasheet-33003883.pdf?src-supplier=Newark; ComponentLink23URL: https://datasheet.octopart.com:443/0532610871-Molex-datasheet-11889475.pdf?src-supplier=Arrow+Electronics; ComponentLink23Description: https://datasheet.octopart.com:443/0532610871-Molex-datasheet-11889475.pdf?src-supplier=Arrow+Electronics; ComponentLink24URL: https://datasheet.octopart.com:443/53261-0871-Molex-datasheet-17741852.pdf?src-supplier=Jameco+(USA); ComponentLink24Description: https://datasheet.octopart.com:443/53261-0871-Molex-datasheet-17741852.pdf?src-supplier=Jameco+(USA); ComponentLink25URL: https://datasheet.octopart.com:443/53261-0871-Molex-datasheet-145971.pdf?src-supplier=DigiKey; ComponentLink25Description: https://datasheet.octopart.com:443/53261-0871-Molex-datasheet-145971.pdf?src-supplier=DigiKey; ComponentLink26URL: http://sigma.octopart.com:80/16413779/rohs_statement/Molex-53261-0871.pdf?src-supplier=Compliance+Statements; ComponentLink26Description: http://sigma.octopart.com:80/16413779/rohs_statement/Molex-53261-0871.pdf?src-supplier=Compliance+Statements; ComponentLink27URL: http://sigma.octopart.com:80/reach_statement/Molex-company-74.pdf?src-supplier=Compliance+Statements; ComponentLink27Description: http://sigma.octopart.com:80/reach_statement/Molex-company-74.pdf?src-supplier=Compliance+Statements; ComponentLink28URL: http://sigma.octopart.com:80/rohs_statement/Molex-company-73.pdf?src-supplier=Compliance+Statements; ComponentLink28Description: http://sigma.octopart.com:80/rohs_statement/Molex-company-73.pdf?src-supplier=Compliance+Statements; ComponentLink29URL: http://sigma.octopart.com:80/conflict_mineral_statement/Molex-company-72.pdf?src-supplier=Compliance+Statements; ComponentLink29Description: http://sigma.octopart.com:80/conflict_mineral_statement/Molex-company-72.pdf?src-supplier=Compliance+Statements; Supplier Part Number 1: WM7626CT-ND
P5 = SM02B-SRSS-TB: Board Connector, 2 Contact(s), 1 Row(s), Male, Right Angle, Surface Mount Terminal; Manufacturer: JST; Connector Type: Male Pin; Number of Contacts: 2; Pitch: 1mm; Supplier 1: DigiKey; Manufacturer Part Number: SM02B-SRSS-TB; RoHS: Compliant; Category: Card Edge Connectors; Stock 1: 48272; Pricing 1: 1=0.38, 10=0.325, 100=0.2759, 500=0.2462, 1000=0.23443 (USD); Color: Natural; Contact Plating: Tin; Gender: Male; Housing Color: Natural; Housing Material: Nylon; Lead Free: Contains Lead; Lifecycle Status: Obsolete; Max Operating Temperature: 85°C; Min Operating Temperature: -25°C; Mount: Surface Mount; Number of Pins: 2; Number of Positions: 2; Number of Rows: 1; Orientation: Right Angle; Terminal Pitch: 1mm; Termination: Solder; ComponentLink1URL: https://datasheet.octopart.com:443/SM02B-SRSS-TB-JST-datasheet-12513377.pdf?src-supplier=Upverter; ComponentLink1Description: https://datasheet.octopart.com:443/SM02B-SRSS-TB-JST-datasheet-12513377.pdf?src-supplier=Upverter; ComponentLink2URL: https://datasheet.octopart.com:443/SM02B-SRSS-TB-JST-datasheet-180492086.pdf?src-supplier=IHS; ComponentLink2Description: https://datasheet.octopart.com:443/SM02B-SRSS-TB-JST-datasheet-180492086.pdf?src-supplier=IHS; ComponentLink3URL: https://datasheet.octopart.com:443/SM02B-SRSS-TB-JST-datasheet-44103209.pdf?src-supplier=TME; ComponentLink3Description: https://datasheet.octopart.com:443/SM02B-SRSS-TB-JST-datasheet-44103209.pdf?src-supplier=TME; ComponentLink4URL: https://datasheet.octopart.com:443/SM02B-SRSS-TB-JST-datasheet-118603.pdf?src-supplier=DigiKey; ComponentLink4Description: https://datasheet.octopart.com:443/SM02B-SRSS-TB-JST-datasheet-118603.pdf?src-supplier=DigiKey; Supplier Part Number 1: 455-SM02B-SRSS-TBCT-ND
Q1 = AO3401A: Transistor: P-MOSFET; unipolar; -30V; 4, 2A; 1, 4W; 85 mOhm; ; -55+150 st.C; SMD; SOT23; Manufacturer: Alpha & Omega Semiconductor; Continuous Drain Current (ID): 4A; Drain to Source Resistance: 50mΩ; Gate to Source Voltage (Vgs): 12V; Input Capacitance: 1.2nF; Max Junction Temperature (Tj): 150°C; Max Power Dissipation: 1.4W; Min Breakdown Voltage: 30V; Number of Channels: 1; Rds On Max: 44mΩ; Threshold Voltage: -900mV; Turn-Off Delay Time: 41ns; Turn-On Delay Time: 6.5ns; Supplier 1: DigiKey; Manufacturer Part Number: AO3401A; RoHS: Compliant; Category: MOSFETs; Stock 1: 230075; Pricing 1: 1=0.52, 10=0.322, 100=0.2043, 500=0.15316, 1000=0.13665 (USD); Case/Package: TO-236-3; Country of Origin: Mainland China; Drain to Source Breakdown Voltage: -30V; Drain to Source Voltage (Vdss): -30V; Export Control Classification Number (ECCN) Code: EAR99; Height: 1.25mm; Introduction Date: 2007-04-10; Lead Free: Lead Free; Lifecycle Status: Production; Max Operating Temperature: 150°C; Min Operating Temperature: -55°C; Mount: Surface Mount; Number of Elements: 1; Number of Pins: 3; Number of Terminals: 3; Power Dissipation: 1.4W; Radiation Hardening: No; REACH SVHC: Yes; Schedule B: 8541290080, 8541290080|8541290080|8541290080|8541290080|8541290080; ComponentLink1URL: https://datasheet.octopart.com:443/AO3401A-Alpha-%26-Omega-Semiconductor-datasheet-11631723.pdf?src-supplier=IHS; ComponentLink1Description: https://datasheet.octopart.com:443/AO3401A-Alpha-%26-Omega-Semiconductor-datasheet-11631723.pdf?src-supplier=IHS; ComponentLink2URL: https://sigma.octopart.com:443/138895710/technical_drawing/Alpha-%26-Omega-Semiconductor-AO3401A.pdf?src-supplier=Upverter; ComponentLink2Description: https://sigma.octopart.com:443/138895710/technical_drawing/Alpha-%26-Omega-Semiconductor-AO3401A.pdf?src-supplier=Upverter; ComponentLink3URL: https://sigma.octopart.com:443/140150677/technical_drawing/Alpha-%26-Omega-Semiconductor-AO3401A.pdf?src-supplier=Alpha+%26+Omega+Semiconductor+SCT; ComponentLink3Description: https://sigma.octopart.com:443/140150677/technical_drawing/Alpha-%26-Omega-Semiconductor-AO3401A.pdf?src-supplier=Alpha+%26+Omega+Semiconductor+SCT; ComponentLink4URL: https://datasheet.octopart.com:443/AO3401A-Alpha-%26-Omega-Semiconductor-datasheet-14060796.pdf?src-supplier=iiiC; ComponentLink4Description: https://datasheet.octopart.com:443/AO3401A-Alpha-%26-Omega-Semiconductor-datasheet-14060796.pdf?src-supplier=iiiC; Supplier Part Number 1: 785-1001-1-ND
R11 = RCS04020000Z0ED: 0Ω Resistor, Jumper, 0402 [1005 Metric], Thick Film, 200 mW, 3 A, Surface Mount Device; Manufacturer: Vishay; Max Current Rating: 3A; Voltage Rating: 50V; Supplier 1: DigiKey; Manufacturer Part Number: RCS04020000Z0ED; RoHS: Compliant; Category: Chip SMD Resistors; Stock 1: 775160; Pricing 1: 1=0.1, 10=0.032, 25=0.0268, 50=0.0232, 100=0.0204, 250=0.01728, 500=0.01532, 1000=0.01364, 5000=0.01064 (USD); Case Code (Imperial): 0402; Case Code (Metric): 1005; China RoHS: Non-Compliant; Composition: Thick Film; Country of Origin: Israel, Mainland China; Export Control Classification Number (ECCN) Code: EAR99; Features: Automotive AEC-Q200; Height: 350µm; Harmonized Tariff Schedule (HTS) Code: 8533.21.00.30; Introduction Date: 2016-07-12; Length: 1mm; Lifecycle Status: Production; Max Operating Temperature: 155°C; Max Power Dissipation: 200mW; Min Operating Temperature: -55°C; Mount: Surface Mount; Number of Terminals: 2; Number of Terminations: 2; Ratings: AEC-Q200; REACH SVHC: Yes; Voltage Rating (DC): 50V; Width: 500µm; ComponentLink1URL: https://datasheet.octopart.com:443/RCS04020000Z0ED-Vishay-datasheet-176436275.pdf?src-supplier=IHS; ComponentLink1Description: https://datasheet.octopart.com:443/RCS04020000Z0ED-Vishay-datasheet-176436275.pdf?src-supplier=IHS; ComponentLink2URL: https://datasheet.octopart.com:443/RCS04020000Z0ED-Vishay-datasheet-86813749.pdf?src-supplier=Future+Electronics; ComponentLink2Description: https://datasheet.octopart.com:443/RCS04020000Z0ED-Vishay-datasheet-86813749.pdf?src-supplier=Future+Electronics; ComponentLink3URL: http://sigma.octopart.com:80/rohs_statement/Vishay-company-15.pdf?src-supplier=Compliance+Statements; ComponentLink3Description: http://sigma.octopart.com:80/rohs_statement/Vishay-company-15.pdf?src-supplier=Compliance+Statements; Supplier Part Number 1: 541-2877-6-ND
U9 U10 = TPD4E02B04DQAR: Tvs Diodes & Esd Suppressors; TPD4E02B04DQAR; Texas Instruments; 3.6 V; 8.8 V; 5.5 V; 6.4 V; Manufacturer Lifecycle Status: ACTIVE; Breakdown Voltage: 6.4V; Capacitance: 250fF; Clamping Voltage: 8.8V; Direction: Bidirectional; Interface: Ethernet; Min Breakdown Voltage: 5.5V; Number of Bidirectional Channels: 4; Operating Supply Voltage: 3.6V; Peak Pulse Current: 2A; Peak Pulse Power: 17W; Power Line Protection: No; Supplier 1: DigiKey; Manufacturer: Texas Instruments; Manufacturer Part Number: TPD4E02B04DQAR; RoHS: Compliant; Category: TVS Diodes; Stock 1: 7356; Pricing 1: 1=1.11, 10=0.694, 100=0.4535, 500=0.34992, 1000=0.31655 (USD); Ambient Temperature Range High: 125°C; Composition: Zener; Height: 550µm; Lead Free: Lead Free; Length: 2.5mm; Lifecycle Status: Production; Max Operating Temperature: 125°C; Min Operating Temperature: -40°C; Mount: Surface Mount; Number of Channels: 4; Number of Pins: 10; Packaging: Cut Tape; REACH SVHC: No; Reverse Standoff Voltage: 3.6V; Schedule B: 8541100080, 8541100080|8541100080|8541100080|8541100080|8541100080; Thickness: 500µm; Width: 1mm; ComponentLink1URL: https://sigma.octopart.com:443/176143083/technical_drawing/Texas-Instruments-TPD4E02B04DQAR.pdf?src-supplier=Texas+Instruments; ComponentLink1Description: https://sigma.octopart.com:443/176143083/technical_drawing/Texas-Instruments-TPD4E02B04DQAR.pdf?src-supplier=Texas+Instruments; ComponentLink2URL: https://octopart.com:443/opatz8j6/c1?t=aoqDSauUwmHle6qTDBhf01J_x3kMb2tNsy6DVVQxBhwMOFfKV8CkZQkeAg7HStYnhO7loO6NCnDu1YOrv9Z2JQczVlylZGWUOsI57_uevt2i4KjUmUJImJtsNsM8TsbJCJLZRzl3c-JHBOFgKjYzm3f4YkU-aqx3v6cxb1C_ME88aw5ttupZPGMLTNgyHtBJBcpA7ouznK1IKJV2UmyETiVI1pi24i54odCN60WXcAZMQqZ4PrsOmgAalftpno53H2KnyzLpeqa1D7K90IVfQHoOcpwRK6PpTcRmz9oJErDp9YFCGvc7QJo0rve7mXR72TJL87rmV4JS1nvPfqc5mZqgKm5dyfH3wfm-8AMgzoYYSqgqwA0y9g-vb7wUQDN8CkBv7YuzpFQ&src-supplier=Texas+Instruments; ComponentLink2Description: https://octopart.com:443/opatz8j6/c1?t=aoqDSauUwmHle6qTDBhf01J_x3kMb2tNsy6DVVQxBhwMOFfKV8CkZQkeAg7HStYnhO7loO6NCnDu1YOrv9Z2JQczVlylZGWUOsI57_uevt2i4KjUmUJImJtsNsM8TsbJCJLZRzl3c-JHBOFgKjYzm3f4YkU-aqx3v6cxb1C_ME88aw5ttupZPGMLTNgyHtBJBcpA7ouznK1IKJV2UmyETiVI1pi24i54odCN60WXcAZMQqZ4PrsOmgAalftpno53H2KnyzLpeqa1D7K90IVfQHoOcpwRK6PpTcRmz9oJErDp9YFCGvc7QJo0rve7mXR72TJL87rmV4JS1nvPfqc5mZqgKm5dyfH3wfm-8AMgzoYYSqgqwA0y9g-vb7wUQDN8CkBv7YuzpFQ&src-supplier=Texas+Instruments; ComponentLink3URL: https://datasheet.octopart.com:443/TPD4E02B04DQAR-Texas-Instruments-datasheet-59814757.pdf?src-supplier=Texas+Instruments; ComponentLink3Description: https://datasheet.octopart.com:443/TPD4E02B04DQAR-Texas-Instruments-datasheet-59814757.pdf?src-supplier=Texas+Instruments; ComponentLink4URL: https://sigma.octopart.com:443/49262242/technical_drawing/Texas-Instruments-TPD4E02B04DQAR.pdf?src-supplier=Texas+Instruments; ComponentLink4Description: https://sigma.octopart.com:443/49262242/technical_drawing/Texas-Instruments-TPD4E02B04DQAR.pdf?src-supplier=Texas+Instruments; ComponentLink5URL: https://datasheet.octopart.com:443/TPD4E02B04DQAR-Texas-Instruments-datasheet-95279696.pdf?src-supplier=Upverter; ComponentLink5Description: https://datasheet.octopart.com:443/TPD4E02B04DQAR-Texas-Instruments-datasheet-95279696.pdf?src-supplier=Upverter; ComponentLink6URL: https://datasheet.octopart.com:443/TPD4E02B04DQAR-Texas-Instruments-datasheet-66617599.pdf?src-supplier=element14+APAC; ComponentLink6Description: https://datasheet.octopart.com:443/TPD4E02B04DQAR-Texas-Instruments-datasheet-66617599.pdf?src-supplier=element14+APAC; ComponentLink7URL: https://datasheet.octopart.com:443/TPD4E02B04DQAR-Texas-Instruments-datasheet-62283090.pdf?src-supplier=Newark; ComponentLink7Description: https://datasheet.octopart.com:443/TPD4E02B04DQAR-Texas-Instruments-datasheet-62283090.pdf?src-supplier=Newark; ComponentLink8URL: https://datasheet.octopart.com:443/TPD4E02B04DQAR-Texas-Instruments-datasheet-164419877.pdf?src-supplier=Augswan; ComponentLink8Description: https://datasheet.octopart.com:443/TPD4E02B04DQAR-Texas-Instruments-datasheet-164419877.pdf?src-supplier=Augswan; ComponentLink9URL: https://datasheet.octopart.com:443/TPD4E02B04DQAR-Texas-Instruments-datasheet-159117911.pdf?src-supplier=LCSC; ComponentLink9Description: https://datasheet.octopart.com:443/TPD4E02B04DQAR-Texas-Instruments-datasheet-159117911.pdf?src-supplier=LCSC; ComponentLink10URL: https://datasheet.octopart.com:443/TPD4E02B04DQAR-Texas-Instruments-datasheet-164847889.pdf?src-supplier=Arrow.cn; ComponentLink10Description: https://datasheet.octopart.com:443/TPD4E02B04DQAR-Texas-Instruments-datasheet-164847889.pdf?src-supplier=Arrow.cn; ComponentLink11URL: https://datasheet.octopart.com:443/TPD4E02B04DQAR-Texas-Instruments-datasheet-137316104.pdf?src-supplier=Future+Electronics; ComponentLink11Description: https://datasheet.octopart.com:443/TPD4E02B04DQAR-Texas-Instruments-datasheet-137316104.pdf?src-supplier=Future+Electronics; ComponentLink12URL: http://sigma.octopart.com:80/reach_statement/Texas-Instruments-company-64.pdf?src-supplier=Compliance+Statements; ComponentLink12Description: http://sigma.octopart.com:80/reach_statement/Texas-Instruments-company-64.pdf?src-supplier=Compliance+Statements; ComponentLink13URL: http://sigma.octopart.com:80/conflict_mineral_statement/Texas-Instruments-company-63.pdf?src-supplier=Compliance+Statements; ComponentLink13Description: http://sigma.octopart.com:80/conflict_mineral_statement/Texas-Instruments-company-63.pdf?src-supplier=Compliance+Statements; Supplier Part Number 1: 296-43875-1-ND